# Altium schematic sheet Sheet1.SchDoc
size A4; SheetNumber: 1; SheetTotal: 1
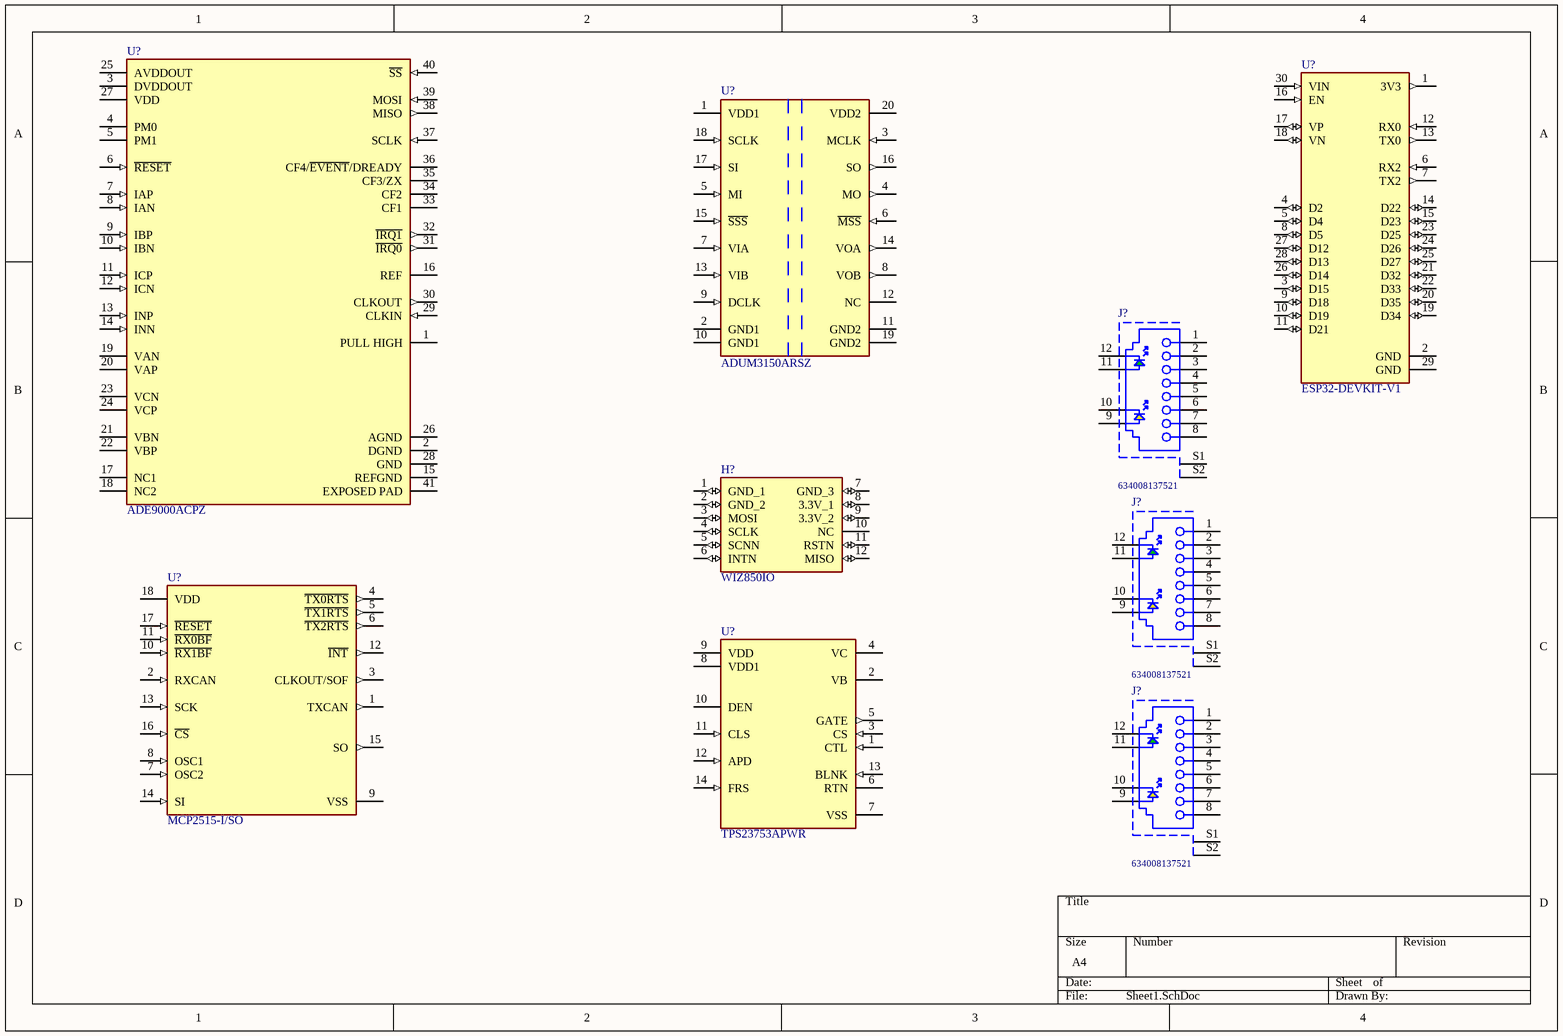
[diagram p0: Sheet1.SchDoc]

## Parts
(Parts that share a designator on the sheet are numbered #1, #2 ... from top to bottom, then left to right.)
H?  WIZ850IO  [WIZ850IO]
J?#1  634008137521  [634008137521]
J?#2  634008137521  [634008137521]
J?#3  634008137521  [634008137521]
U?#1  ADE9000ACPZ  [FP-CP-40-7-IPC_C]
U?#2  ADUM3150ARSZ  [FP-RS-20-IPC_C]
U?#3  ESP32-DEVKIT-V1  [MODULE_ESP32_DEVKIT_V1]
U?#4  MCP2515-I/SO  [FP-C04-051-MFG]
U?#5  TPS23753APWR  [FP-PW0014A-IPC_A]

## Nets

Not connected (* = marked no-connect by the designer): H? 1(GND_1) 2(GND_2) 3(MOSI) 4(SCLK) 5(SCNN) 6(INTN) 7(GND_3) 8(3.3V_1) 9(3.3V_2) 10(NC) 11(RSTN) 12(MISO); J?#1 1 2 3 4 5 6 7 8 9 10 11 12 S1 S2; J?#2 1 2 3 4 5 6 7 8 9 10 11 12 S1 S2; J?#3 1 2 3 4 5 6 7 8 9 10 11 12 S1 S2; U?#1 1(PULL_HIGH) 2(DGND) 3(DVDDOUT) 4(PM0) 5(PM1) 6(~{RESET}) 7(IAP) 8(IAN) 9(IBP) 10(IBN) 11(ICP) 12(ICN) 13(INP) 14(INN) 15(REFGND) 16(REF) 17(NC1) 18(NC2) 19(VAN) 20(VAP) 21(VBN) 22(VBP) 23(VCN) 24(VCP) 25(AVDDOUT) 26(AGND) 27(VDD) 28(GND) 29(CLKIN) 30(CLKOUT) 31(~{IRQ0}) 32(~{IRQ1}) 33(CF1) 34(CF2) 35(CF3/ZX) 36(CF4/~{EVENT}/DREADY) 37(SCLK) 38(MISO) 39(MOSI) 40(~{SS}) 41(EXPOSED_PAD); U?#2 1(VDD1) 2(GND1) 3(MCLK) 4(MO) 5(MI) 6(~{MSS}) 7(VIA) 8(VOB) 9(DCLK) 10(GND1) 11(GND2) 12(NC) 13(VIB) 14(VOA) 15(~{SSS}) 16(SO) 17(SI) 18(SCLK) 19(GND2) 20(VDD2); U?#3 1(3V3) 2(GND) 3(D15) 4(D2) 5(D4) 6(RX2) 7(TX2) 8(D5) 9(D18) 10(D19) 11(D21) 12(RX0) 13(TX0) 14(D22) 15(D23) 16(EN) 17(VP) 18(VN) 19(D34) 20(D35) 21(D32) 22(D33) 23(D25) 24(D26) 25(D27) 26(D14) 27(D12) 28(D13) 29(GND) 30(VIN); U?#4 1(TXCAN) 2(RXCAN) 3(CLKOUT/SOF) 4(~{TX0RTS}) 5(~{TX1RTS}) 6(~{TX2RTS}) 7(OSC2) 8(OSC1) 9(VSS) 10(~{RX1BF}) 11(~{RX0BF}) 12(~{INT}) 13(SCK) 14(SI) 15(SO) 16(~{CS}) 17(~{RESET}) 18(VDD); U?#5 1(CTL) 2(VB) 3(CS) 4(VC) 5(GATE) 6(RTN) 7(VSS) 8(VDD1) 9(VDD) 10(DEN) 11(CLS) 12(APD) 13(BLNK) 14(FRS)

## Library data of the parts
H? = WIZ850IO: Ethernet - 10/100 Base-T/TX PHY SPI Interface Module; MF: WIZnet; Package: Module WIZnet; Price: None; Check_prices: https://www.snapeda.com/parts/WIZ850IO/WIZnet/view-part/?ref=eda; Value: *; SnapEDA_Link: https://www.snapeda.com/parts/WIZ850IO/WIZnet/view-part/?ref=snap; MP: WIZ850IO; Availability: In Stock; Purchase-URL: https://pricing.snapeda.com/search/part/WIZ850IO/?ref=eda
J?#1-J?#3 = CMP-1502-01717-1: Modular Jack WR-MJ, Tab Up, Shielded, with LED and EMI Panel Finger, Horizontal Entry, SMT, 8P8C; Manufacturer: Wurth Elektronik; Compliance: Leadfree/RoHS; Contact Resistance: 20mOhm; Working Voltage: 120VAC; Port: 1x1; Rated Current: 1.5A; Withstanding Voltage: 1000VAC; Part Number: 634008137521; Pin Number: 8P8C; Manufacturer URL: http://www.we-online.de; Package Reference: 634008137521; Packaging: TapeandReel; Datasheet URL: https://katalog.we-online.de/em/datasheet/634008137521%283%29.pdf; Entrance: Horizontal; Operating Temperature: -40to85degC; Mounting Technology: SMT; Publisher: WurthElektronik
U?#1 = CMP-09081-000168-1: IC AFE 7 CHAN 40LFCSP-WQ; Number of Channels: 7; Number of Pins: 40; RoHS Compliant: Yes; Packaging: Tray
U?#2 = CMP-09093-000072-1: ADUM3150 - 3.75 KV, 6-CHANNEL, S; Max Input Current: 9mA; Isolated Power: No; Number of Channels: 6; Min Supply Voltage: 3V; Pulse Width Distortion (PWD): 2ns; Turn-On Delay Time: 25ns; Isolation Voltage: 3.75kV; Channel Type: Unidirectional; Polarity: Bidirectional; Max Supply Voltage: 5.5V; Rise Time: 2.5ns; Data Rate: 80Mbps; RoHS Compliant: Yes; Depth: 1.95mm; Max Operating Temperature: 125°C; Package Quantity: 66; Case/Package: SSOP; Weight: 0.016oz; Packaging: Rail/Tube; Number of Pins: 20; Mount: Surface Mount; Contact Plating: Tin; Min Operating Temperature: -40°C; Width: 5.6mm; Lead Free: Contains Lead; Length: 7.5mm; REACH SVHC: No SVHC; Propagation Delay: 25ns
U?#3 = ESP32-DEVKIT-V1: Dual core, Wi-Fi: 2.4 GHz up to 150 Mbits/s,BLE (Bluetooth Low Energy) and legacy Bluetooth, 32 bits, Up to 240 MHz; MF: Do it; Price: None; Availability: Not in stock; Package: None; MP: ESP32-DEVKIT-V1; Value: *; SnapEDA_Link: https://www.snapeda.com/parts/ESP32-DEVKIT-V1/Do+it/view-part/?ref=snap; Check_prices: https://www.snapeda.com/parts/ESP32-DEVKIT-V1/Do+it/view-part/?ref=eda
U?#4 = CMP-0186-00133-3: IC CAN CONTROLLER W/SPI 18SOIC; Manufacturer: Microchip; Min Supply Voltage: 2.7V; Max Supply Voltage: 5.5V; Standoff Height: 0.1mm; Nominal Supply Current: 10mA; Interface: SPI,CAN; Description: Stand-Alone CAN Controller with SPI Interface; Lead Free: Yes; Digikey Description: IC CAN CONTROLLER W/SPI 18SOIC; Category: IC; RoHS: TRUE; Manufacturer Part Number: MCP2515-I/SO; ComponentLink2URL: http://ww1.microchip.com/downloads/en/DeviceDoc/MCP2515-Stand-Alone-CAN-Controller-with-SPI-20001801J.pdf; Mouser Description: CAN Interface IC W/ SPI Interface; Device Class L2: Interface ICs; Package: C04-051; Automotive: No; Function: Controller; Octopart: https://octopart.com/mcp2515-i%2Fso-microchip-430187; Temperature: -40°C to +85°C; Ipc Land Pattern Name: SOIC127P1030X265-18; Ambient Temperature Range Low: -65°C; Height: 2.65mm; Device Class L1: Integrated Circuits (ICs); Ambient Temperature Range High: +125°C; Footprint Url: http://ww1.microchip.com/downloads/en/DeviceDoc/18L_SOIC_Wide_7.50_SO_C04-0051D.pdf; Temperature Range Low: -40°C; Device Class L3: Controllers; Temperature Range High: +85°C; ComponentLink2Description: Datasheet
U?#5 = CMP-0390-00044-3: IC POE CNTRL 1 CHANNEL 14TSSOP; Min Supply Voltage: 0V; Max Supply Voltage: 57V; Power Dissipation: 13W; Turn-Off Delay Time: 60ns; Operating Supply Current: 580uA; On-State Resistance: 1.2R; Frequency: 248kHz; Number of Channels: 1; Min Current Limit: 405mA; REACH SVHC: No SVHC; Height: 1.15mm; Contact Plating: Gold; Package Quantity: 2000; Number of Pins: 14; Length: 5mm; Radiation Hardening: No; Max Operating Temperature: 125°C; Max Power Dissipation: 13W; Lead Free: Lead Free; Series: -; RoHS Compliant: Yes; Min Operating Temperature: -40°C; Packaging: Tape and Reel; Case/Package: TSSOP